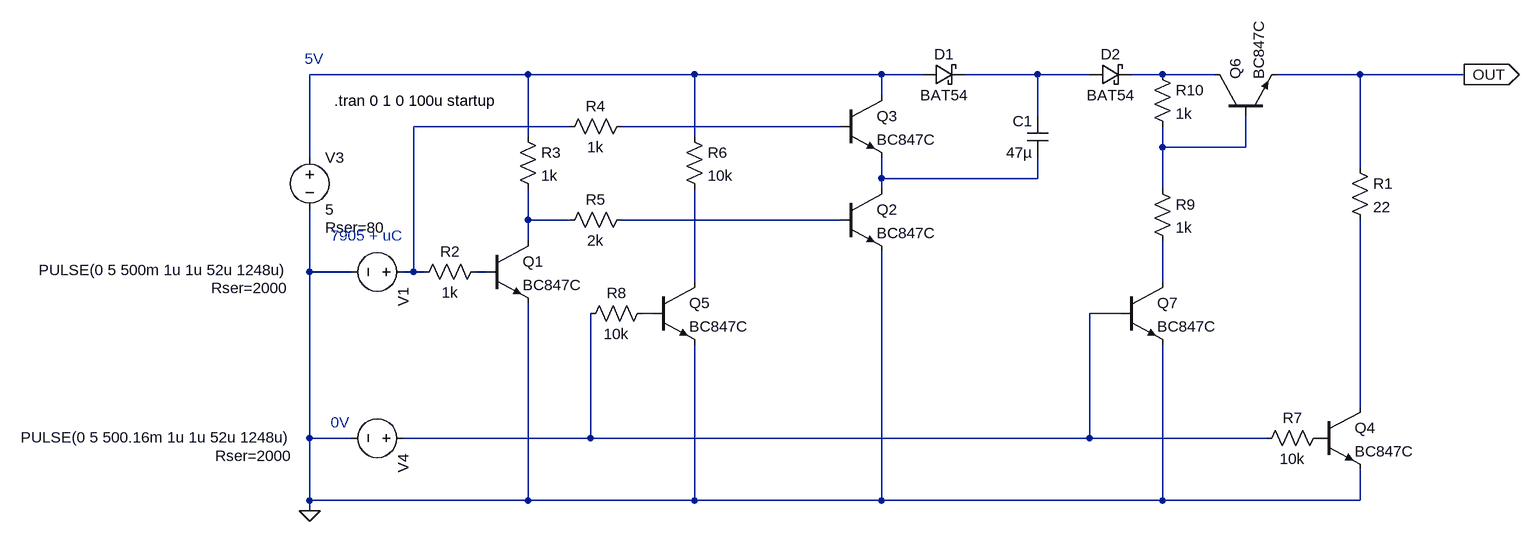
[diagram p0: schematic DriverA7.asc]
DriverA7.asc, the LTspice schematic file:
Version 4
SHEET 1 1772 804
WIRE 208 16 -128 16
WIRE 464 16 208 16
WIRE 752 16 464 16
WIRE 816 16 752 16
WIRE 992 16 880 16
WIRE 1072 16 992 16
WIRE 1184 16 1136 16
WIRE 1264 16 1184 16
WIRE 1488 16 1360 16
WIRE 1648 16 1488 16
WIRE 752 48 752 16
WIRE 992 80 992 16
WIRE 272 96 32 96
WIRE 688 96 352 96
WIRE 208 112 208 16
WIRE 464 112 464 16
WIRE 1184 128 1184 96
WIRE 1312 128 1312 80
WIRE 1312 128 1184 128
WIRE -128 144 -128 16
WIRE 1488 160 1488 16
WIRE 752 176 752 144
WIRE 992 176 992 144
WIRE 992 176 752 176
WIRE 752 192 752 176
WIRE 1184 192 1184 128
WIRE 208 240 208 192
WIRE 272 240 208 240
WIRE 688 240 352 240
WIRE 208 272 208 240
WIRE -128 320 -128 224
WIRE -64 320 -128 320
WIRE 32 320 32 96
WIRE 32 320 16 320
WIRE 48 320 32 320
WIRE 144 320 128 320
WIRE 464 336 464 192
WIRE 1184 336 1184 272
WIRE 400 384 384 384
WIRE 1120 384 1072 384
WIRE 1488 528 1488 240
WIRE -128 576 -128 320
WIRE -64 576 -128 576
WIRE 304 576 304 384
WIRE 304 576 16 576
WIRE 1072 576 1072 384
WIRE 1072 576 304 576
WIRE 1344 576 1072 576
WIRE -128 672 -128 576
WIRE 208 672 208 368
WIRE 208 672 -128 672
WIRE 464 672 464 432
WIRE 464 672 208 672
WIRE 752 672 752 288
WIRE 752 672 464 672
WIRE 1184 672 1184 432
WIRE 1184 672 752 672
WIRE 1488 672 1488 624
WIRE 1488 672 1184 672
WIRE -128 688 -128 672
FLAG 1648 16 OUT
IOPIN 1648 16 Out
FLAG -128 688 0
SYMBOL voltage 32 320 R90
WINDOW 3 -3 192 VRight 2
WINDOW 123 0 0 Left 0
WINDOW 39 25 192 VRight 2
SYMATTR InstName V1
SYMATTR Value PULSE(0 5 500m 1u 1u 52u 1248u)
SYMATTR SpiceLine Rser=2000
SYMBOL cap 1008 144 R180
WINDOW 0 24 56 Left 2
WINDOW 3 24 8 Left 2
SYMATTR InstName C1
SYMATTR Value 47µ
SYMBOL schottky 816 32 R270
WINDOW 0 32 32 VTop 2
WINDOW 3 0 32 VBottom 2
SYMATTR InstName D1
SYMATTR Value BAT54
SYMATTR Description Diode
SYMATTR Type diode
SYMBOL schottky 1072 32 R270
WINDOW 0 32 32 VTop 2
WINDOW 3 0 32 VBottom 2
SYMATTR InstName D2
SYMATTR Value BAT54
SYMATTR Description Diode
SYMATTR Type diode
SYMBOL voltage -128 128 R0
WINDOW 123 0 0 Left 0
WINDOW 39 24 124 Left 2
SYMATTR InstName V3
SYMATTR Value 5
SYMATTR SpiceLine Rser=80
SYMBOL npn 144 272 R0
SYMATTR InstName Q1
SYMATTR Value BC847C
SYMBOL res 144 304 R90
WINDOW 0 0 56 VBottom 2
WINDOW 3 32 56 VTop 2
SYMATTR InstName R2
SYMATTR Value 1k
SYMBOL res 192 96 R0
SYMATTR InstName R3
SYMATTR Value 1k
SYMBOL npn 688 192 R0
SYMATTR InstName Q2
SYMATTR Value BC847C
SYMBOL res 368 224 R90
WINDOW 0 0 56 VBottom 2
WINDOW 3 32 56 VTop 2
SYMATTR InstName R5
SYMATTR Value 2k
SYMBOL npn 688 48 R0
SYMATTR InstName Q3
SYMATTR Value BC847C
SYMBOL res 368 80 R90
WINDOW 0 0 56 VBottom 2
WINDOW 3 32 56 VTop 2
SYMATTR InstName R4
SYMATTR Value 1k
SYMBOL voltage 32 576 R90
WINDOW 3 -1 186 VRight 2
WINDOW 123 0 0 Left 0
WINDOW 39 27 186 VRight 2
SYMATTR InstName V4
SYMATTR Value PULSE(0 5 500.16m 1u 1u 52u 1248u)
SYMATTR SpiceLine Rser=2000
SYMBOL npn 1424 528 R0
SYMATTR InstName Q4
SYMATTR Value BC847C
SYMBOL res 1472 144 R0
SYMATTR InstName R1
SYMATTR Value 22
SYMBOL npn 400 336 R0
SYMATTR InstName Q5
SYMATTR Value BC847C
SYMBOL res 448 96 R0
SYMATTR InstName R6
SYMATTR Value 10k
SYMBOL res 1440 560 R90
WINDOW 0 0 56 VBottom 2
WINDOW 3 32 56 VTop 2
SYMATTR InstName R7
SYMATTR Value 10k
SYMBOL res 400 368 R90
WINDOW 0 0 56 VBottom 2
WINDOW 3 32 56 VTop 2
SYMATTR InstName R8
SYMATTR Value 10k
SYMBOL npn 1264 80 R270
SYMATTR InstName Q6
SYMATTR Value BC847C
SYMBOL res 1168 176 R0
SYMATTR InstName R9
SYMATTR Value 1k
SYMBOL npn 1120 336 R0
SYMATTR InstName Q7
SYMATTR Value BC847C
SYMBOL res 1168 0 R0
SYMATTR InstName R10
SYMATTR Value 1k
TEXT -90 56 Left 2 !.tran 0 1 0 100u startup
TEXT -96 264 Left 2 ;7905 + uC
TEXT -136 -8 Left 2 ;5V
TEXT -96 552 Left 2 ;0V

The netlist it stands for:
* DriverA7.asc
V1 N004 0 PULSE(0 5 500m 1u 1u 52u 1248u) Rser=2000
C1 N007 N002 47µ
D1 N001 N002 BAT54
D2 N002 N003 BAT54
V3 N001 0 5 Rser=80
Q1 N008 N010 0 0 BC847C
R2 N010 N004 1k
R3 N001 N008 1k
Q2 N007 N009 0 0 BC847C
R5 N009 N008 2k
Q3 N001 N005 N007 0 BC847C
R4 N005 N004 1k
V4 N014 0 PULSE(0 5 500.16m 1u 1u 52u 1248u) Rser=2000
Q4 N015 P001 0 0 BC847C
R1 OUT N015 22
Q5 N011 N013 0 0 BC847C
R6 N001 N011 10k
R7 P001 N014 10k
R8 N013 N014 10k
Q6 N003 N006 OUT 0 BC847C
R9 N006 N012 1k
Q7 N012 N014 0 0 BC847C
R10 N003 N006 1k
.model D D
.lib standard.dio
.model NPN NPN
.model PNP PNP
.lib standard.bjt
.tran 0 1 0 100u startup
* 7905 + uC
* 5V
* 0V
.backanno
.end